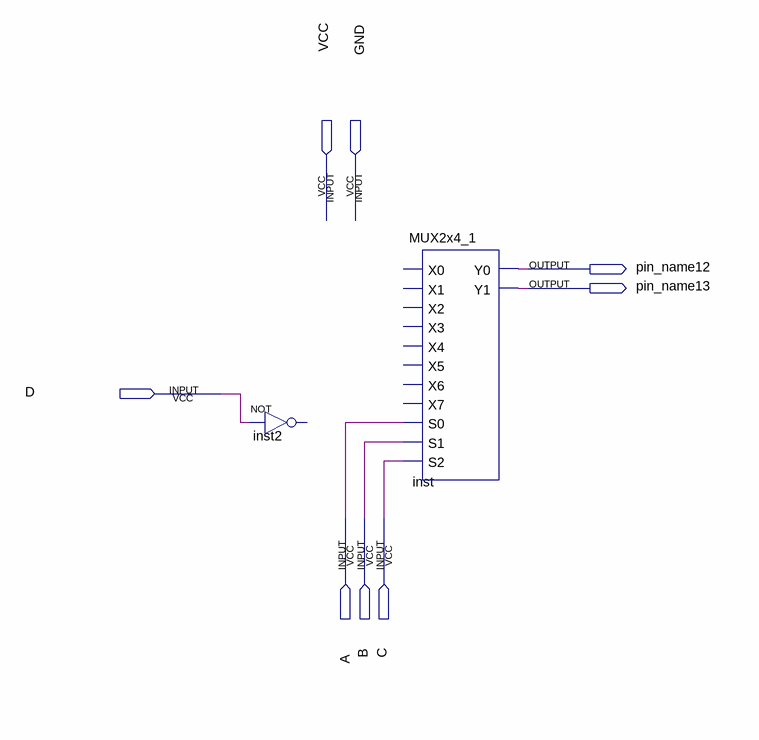
[diagram p0: schematic sheet]
// Quartus schematic ex3.bdf as structural Verilog: 2 symbols, 8 pins
module ex3 (
  input  VCC,
  input  GND,
  input  D,
  input  A,
  input  B,
  input  C,
  output pin_name12,
  output pin_name13
);

  // NOT inst2 has open pins: IN=D, OUT=open
  MUX2x4_1 inst (.S0(A), .S1(B), .S2(C), .Y0(pin_name12), .Y1(pin_name13));  // open: X0, X1, X2, X3, X4, X5, X6, X7
endmodule
